# EasyEDA Pro project ProPrj_装配排查_2026-04-26.epro, board PCB2
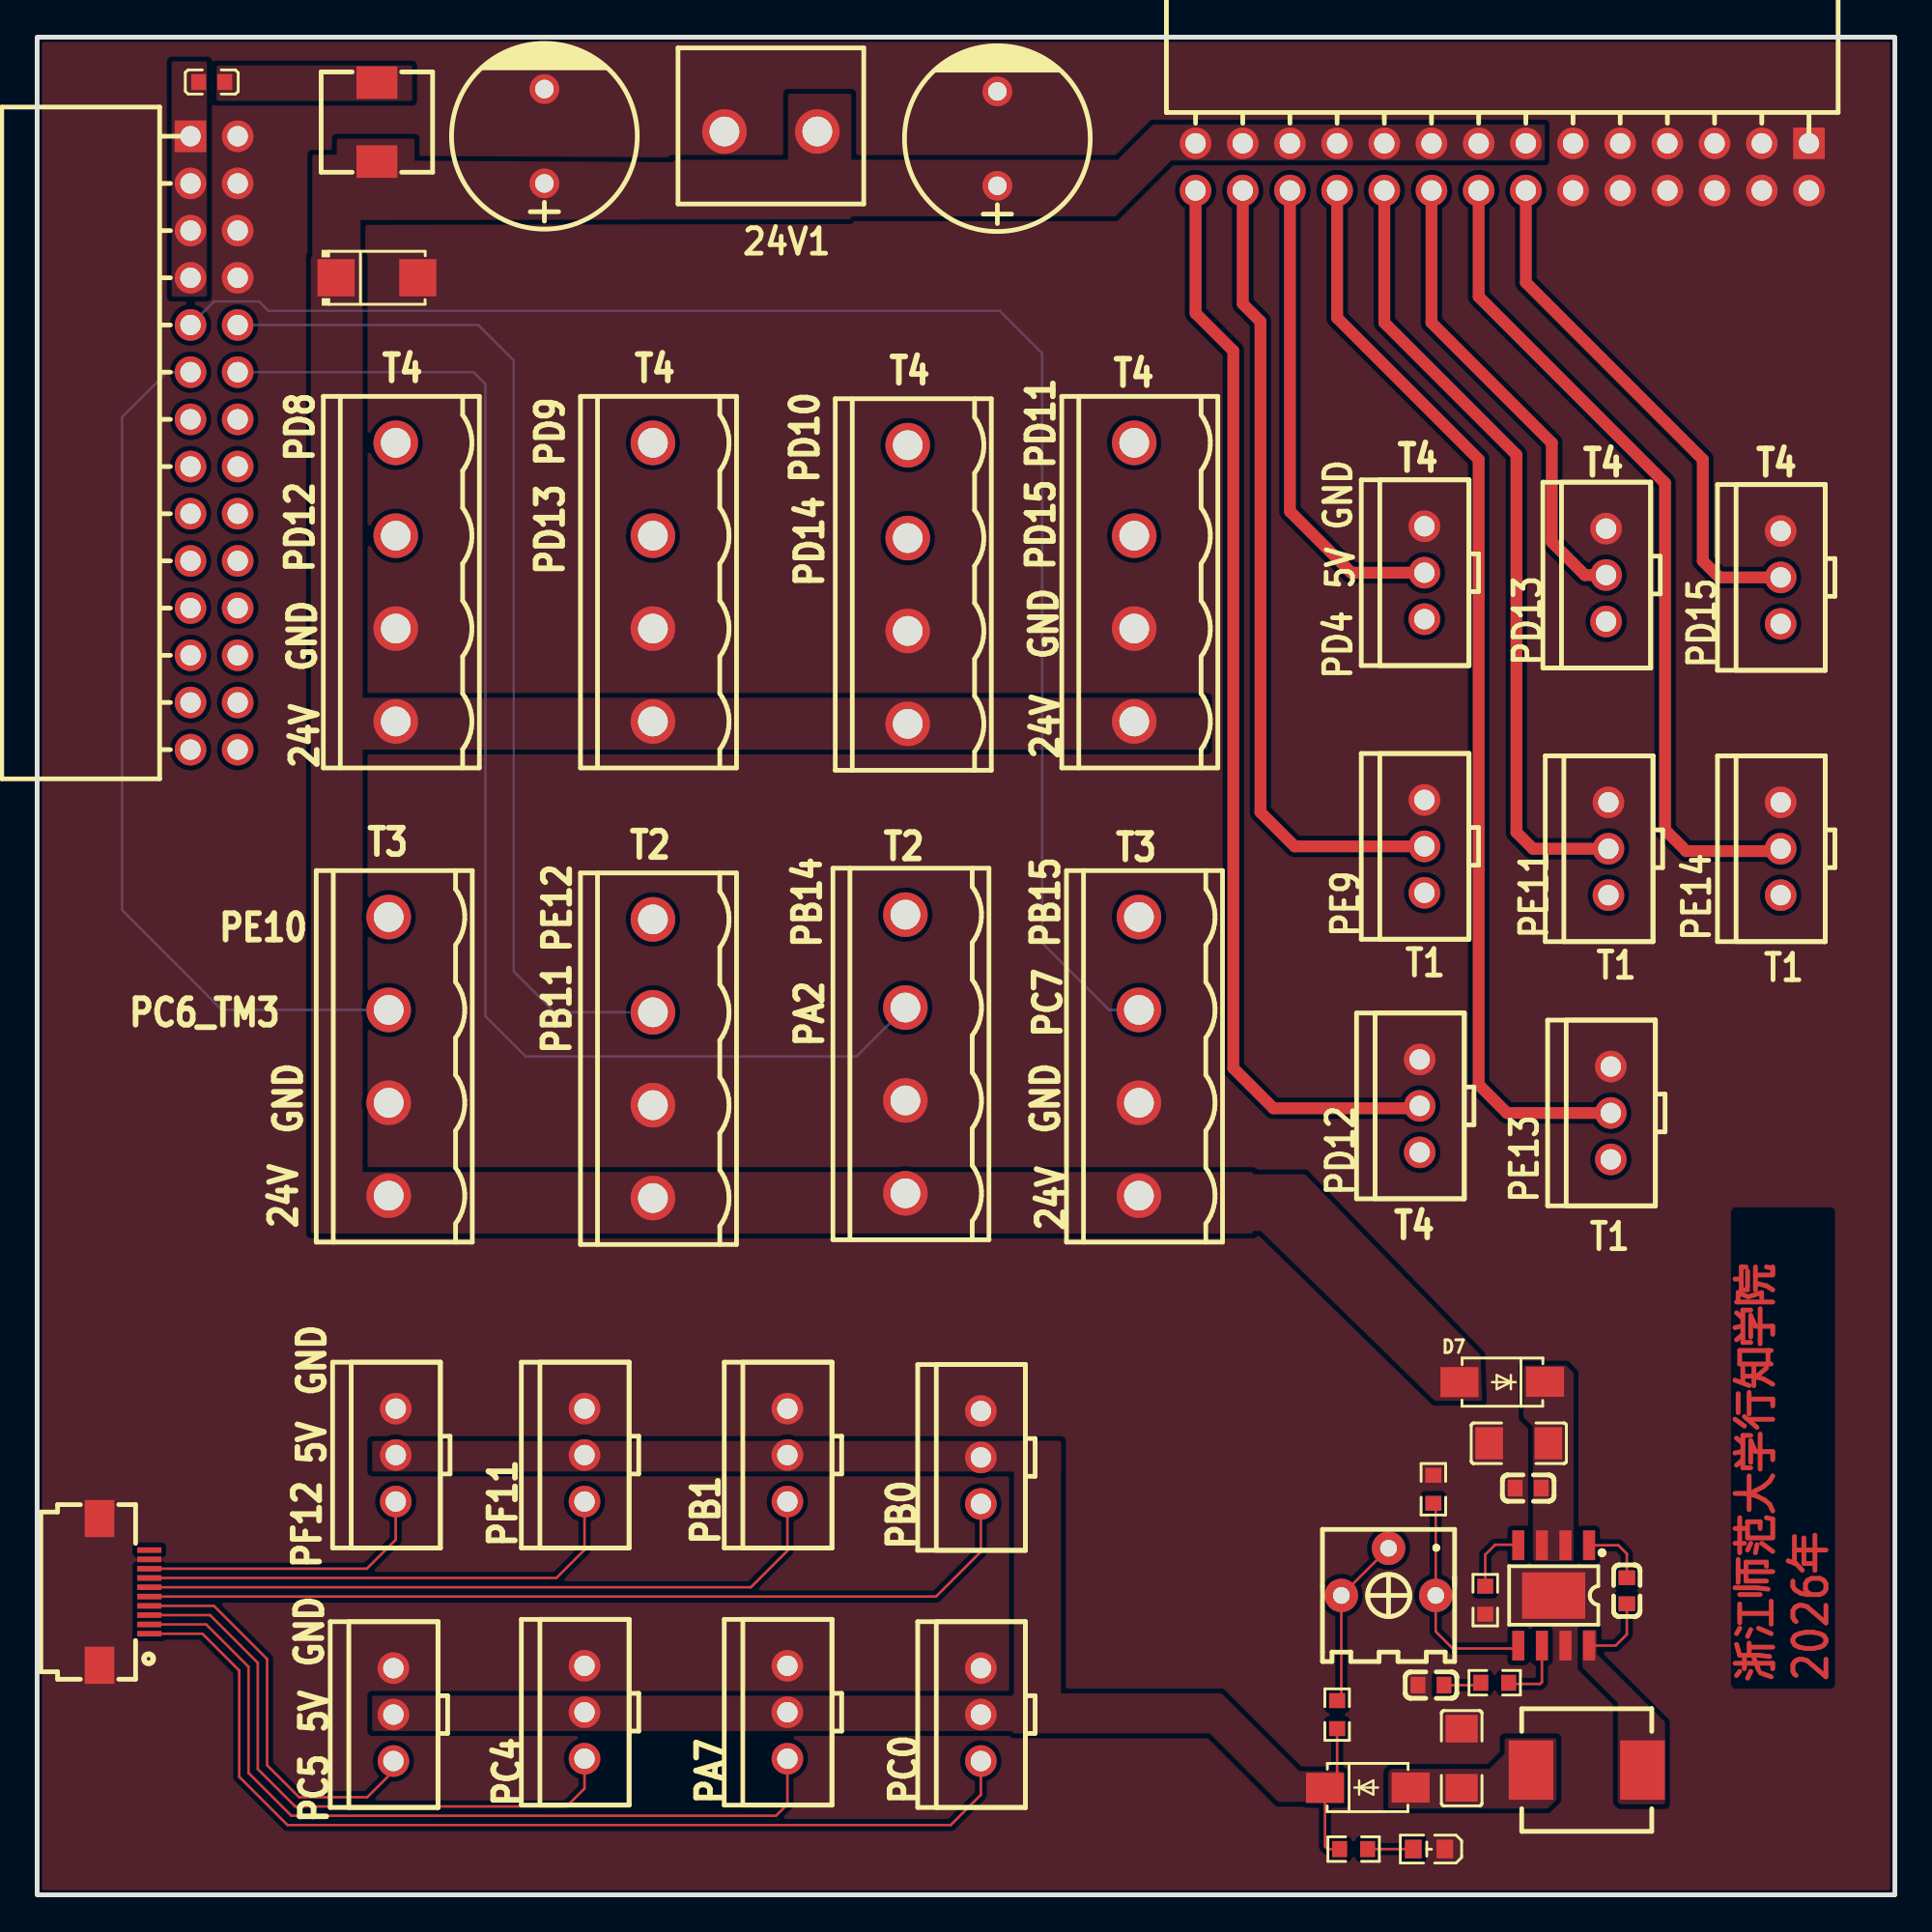
[diagram p2: board, top side]
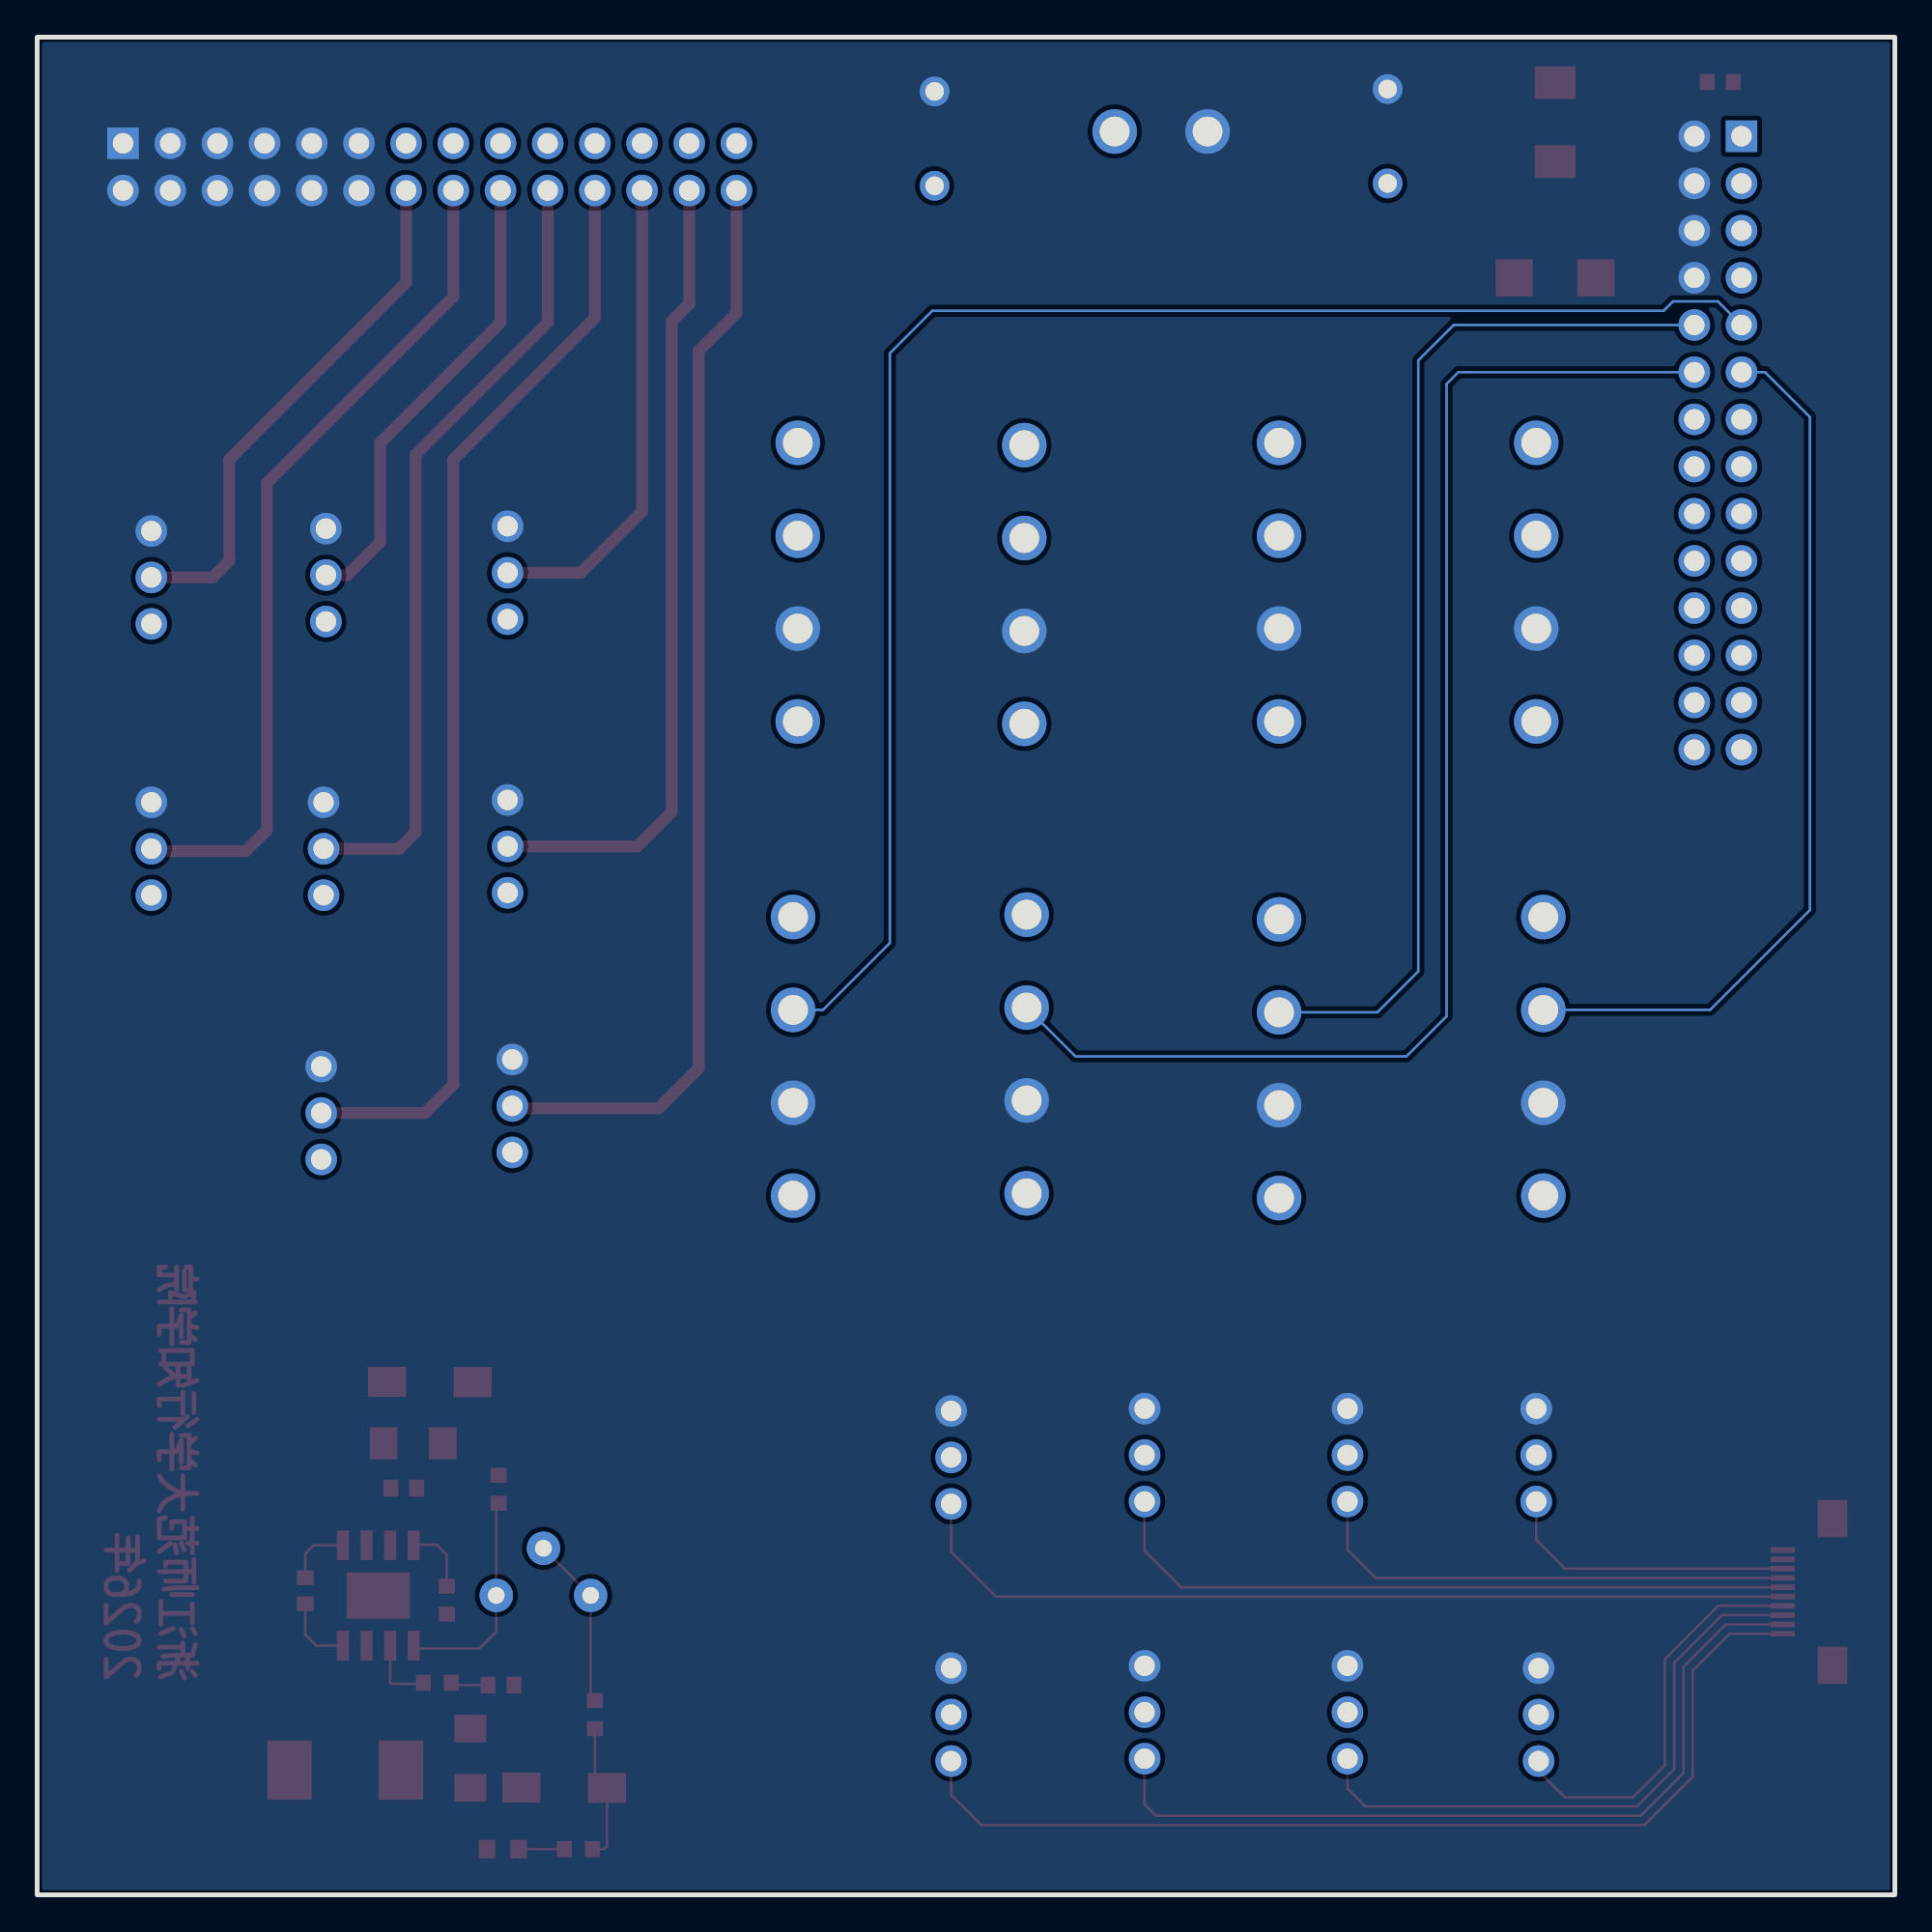
[diagram p3: board, bottom side, seen from below]

Outline 100 x 100 mm; copper layers: Top Layer, Inner1, Inner2, Bottom Layer. Coordinates in mm from the lower left corner of the outline.
Outline path: rectangle 0,100 100,0
Stack: Top Layer 0.035mm / Dielectric1 1.51mm FR4 er 4.5 / Bottom Layer 0.035mm

## Design rules (mm)
spacing copperThickness1oz (default): track to track 0.102, other pairs 0.152 to 0.3
spacing copperThickness2oz: track to track 0.203, other pairs 0.152 to 0.3
track width copperThickness1oz (default): min 0.127, default 0.135, max 2.54
track width copperThickness2oz: min 0.203, default 0.254, max 2.54
differential pair differentialPair (default): width min 0.127, default 0.254, max 2.54; gap min 0.152, default 0.152

## Placement (name value [footprint] x y rotation side)
24V1  12V_IN  [CONN-TH_XY2500V-A-5.00-2P]  39.5 94.92 180 top
C6  470uF  [CAP-TH_BD10.0-P5.00-D1.0-FD]  51.69 94.54 90 top
C7  470uF  [CAP-TH_BD10.0-P5.00-D1.0-FD]  27.3 94.67 90 top
C23  100nF  [C0603]  85.57 16.37 90 top
C24  47uF  [C1206]  76.68 7.35 270 top
C27  4.7uF  [C1206]  79.76 24.31 0 top
C28  100nF  [C0603]  80.26 21.89 0 top
C29  4.7nF  [C0603]  75.03 11.29 0 top
D1  SS54  [SMA_L4.3-W2.6-LS5.2-RD]  18.29 87.05 0 top
D7  SS54  [SMA_L4.3-W2.6-LS5.0-FD]  78.87 27.61 0 top
D8  SS54  [SMA_L4.3-W2.6-LS5.0-FD]  71.63 5.77 180 top
DIANJI1  平滑轨  [CONN-TH_XY2500V-A-5.00-4P]  18.92 45.14 90 top
DIANJI2  平滑轨  [CONN-TH_XY2500V-A-5.00-4P]  33.15 45.01 90 top
DIANJI3  平滑轨  [CONN-TH_XY2500V-A-5.00-4P]  46.74 45.26 90 top
DIANJI4  平滑轨  [CONN-TH_XY2500V-A-5.00-4P]  19.3 70.66 90 top
DIANJI5  平滑轨  [CONN-TH_XY2500V-A-5.00-4P]  59.31 45.14 90 top
DIANJI6  平滑轨  [CONN-TH_XY2500V-A-5.00-4P]  33.15 70.66 90 top
DIANJI7  平滑轨  [CONN-TH_XY2500V-A-5.00-4P]  59.06 70.66 90 top
DIANJI8  平滑轨  [CONN-TH_XY2500V-A-5.00-4P]  46.86 70.54 90 top
FPC1  AFC01-S10FCA-00  [FPC-SMD_P0.5-10P_FGS-XJ-H2.0]  4.7 16.31 90 top
L1  22uH  [IND-SMD_L6.0-W5.2_SUMIDA_CDH53]  18.29 95.43 0 top
L2  BLM18EG121SN1D  [L0603]  9.4 97.59 0 top
L4  4.7uH  [IND-SMD_L7.0-W6.6]  83.41 6.72 180 top
LED5  NCD0603G1  [LED0603-RD_1]  74.93 2.46 180 top
PWM1  HC-XHB-3A  [CONN-TH_3P-P2.50_HC-XHB-3A]  74.42 42.47 90 top
PWM2  HC-XHB-3A  [CONN-TH_3P-P2.50_HC-XHB-3A]  74.68 56.44 90 top
PWM3  HC-XHB-3A  [CONN-TH_3P-P2.50_HC-XHB-3A]  74.68 71.17 90 top
PWM4  HC-XHB-3A  [CONN-TH_3P-P2.50_HC-XHB-3A]  50.8 23.55 90 top
PWM5  HC-XHB-3A  [CONN-TH_3P-P2.50_HC-XHB-3A]  40.39 23.67 90 top
PWM6  HC-XHB-3A  [CONN-TH_3P-P2.50_HC-XHB-3A]  84.71 42.09 90 top
PWM7  HC-XHB-3A  [CONN-TH_3P-P2.50_HC-XHB-3A]  84.58 56.31 90 top
PWM8  HC-XHB-3A  [CONN-TH_3P-P2.50_HC-XHB-3A]  84.45 71.04 90 top
PWM9  HC-XHB-3A  [CONN-TH_3P-P2.50_HC-XHB-3A]  93.85 56.31 90 top
PWM10  HC-XHB-3A  [CONN-TH_3P-P2.50_HC-XHB-3A]  93.85 70.92 90 top
PWM11  HC-XHB-3A  [CONN-TH_3P-P2.50_HC-XHB-3A]  29.46 23.67 90 top
PWM12  HC-XHB-3A  [CONN-TH_3P-P2.50_HC-XHB-3A]  19.3 23.67 90 top
PWM14  HC-XHB-3A  [CONN-TH_3P-P2.50_HC-XHB-3A]  50.8 9.7 90 top
PWM15  HC-XHB-3A  [CONN-TH_3P-P2.50_HC-XHB-3A]  40.39 9.83 90 top
PWM16  HC-XHB-3A  [CONN-TH_3P-P2.50_HC-XHB-3A]  29.46 9.83 90 top
PWM17  HC-XHB-3A  [CONN-TH_3P-P2.50_HC-XHB-3A]  19.18 9.7 90 top
R20  30kΩ  [R0603]  69.98 9.7 270 top
R21  10kΩ  [R0603]  70.87 2.46 180 top
R22  20kΩ  [R0603]  78.46 11.42 180 top
R23  200kΩ  [R0603]  77.95 15.86 90 top
R24  50kΩ  [RES-ADJ-TH_3P-L7.1-W6.9-P2.50-L_3362P]  72.75 17.39 0 top
R25  7.5kΩ  [R0603]  75.16 21.83 270 top
U5  STC2450  [SOP-8E]  81.64 16.12 270 top
U12  Vin  [HDR-TH_28P-P2.54-H-F-R2-C14-W8.5]  78.87 93.01 180 top
U13  OUTPUT  [HDR-TH_28P-P2.54-H-F-R2-C14-W8.5]  9.52 78.16 270 top

## Footprints (pads in the part's own frame, mm; a bottom-side part is the same pattern mirrored in y, then rotated)
C0603
  rect 0.8x0.9 smd: 1(-0.7,0) 2(0.7,0)
C1206
  rect 1.485x1.728 smd: 1(-1.593,0) 2(1.593,0)
CAP-TH_BD10.0-P5.00-D1.0-FD
  round 1.6 hole 1: 1(-2.54,0) 2(2.54,0)
CONN-TH_3P-P2.50_HC-XHB-3A
  round 1.7 hole 1.1: 1(-2.5,0) 2(0,0) 3(2.5,0)
CONN-TH_XY2500V-A-5.00-2P
  round 2.4 hole 1.6: 1(-2.5,0) 2(2.5,0)
CONN-TH_XY2500V-A-5.00-4P
  round 2.4 hole 1.6: 1(-7.5,0) 2(-2.5,0) 3(2.5,0) 4(7.5,0)
FPC-SMD_P0.5-10P_FGS-XJ-H2.0
  rect 0.3x1.3 smd: 1(-2.25,-1.339) 2(-1.75,-1.339) 3(-1.25,-1.34) 4(-0.75,-1.339) 5(-0.25,-1.34) 6(0.25,-1.339) 7(0.75,-1.339) 8(1.25,-1.339) 9(1.75,-1.339) 10(2.25,-1.34)
  rect 2x1.6 smd: 11(3.95,1.34) 12(-3.95,1.34)
HDR-TH_28P-P2.54-H-F-R2-C14-W8.5
  rect 1.7x1.7 hole 1.1: 1(-16.51,-1.27)
  round 1.7 hole 1.1: 2(-16.51,1.27) 3(-13.97,-1.27) 4(-13.97,1.27) 5(-11.43,-1.27) 6(-11.43,1.27) 7(-8.89,-1.27) 8(-8.89,1.27) 9(-6.35,-1.27) 10(-6.35,1.27) 11(-3.81,-1.27) 12(-3.81,1.27) 13(-1.27,-1.27) 14(-1.27,1.27) 15(1.27,-1.27) 16(1.27,1.27) 17(3.81,-1.27) 18(3.81,1.27) 19(6.35,-1.27) 20(6.35,1.27) 21(8.89,-1.27) 22(8.89,1.27) 23(11.43,-1.27) 24(11.43,1.27) 25(13.97,-1.27) 26(13.97,1.27) 27(16.51,-1.27) 28(16.51,1.27)
IND-SMD_L6.0-W5.2_SUMIDA_CDH53
  rect 2.2x1.75 smd: 1(0,2.125) 2(0,-2.125)
IND-SMD_L7.0-W6.6
  rect 2.4x3.2 smd: 1(-3,0) 2(3,0)
L0603
  rect 0.8x0.864 smd: 1(-0.7,0) 2(0.7,0)
LED0603-RD_1
  rect 0.9x1 smd: 1(-0.85,0) 2(0.85,0)
R0603
  rect 0.806x0.864 smd: 1(-0.753,0) 2(0.753,0)
RES-ADJ-TH_3P-L7.1-W6.9-P2.50-L_3362P
  round 1.8 hole 0.9: 1(-2.54,-1.27) 2(0,1.27) 3(2.54,-1.27)
SMA_L4.3-W2.6-LS5.0-FD
  rect 2.046x1.62 smd: 1(-2.304,-0.009) 2(2.304,0.009)
SMA_L4.3-W2.6-LS5.2-RD
  rect 2x2 smd: 1(-2.2,0) 2(2.2,0)
SOP-8E
  rect 2.5x3.4 smd: 0(0,0)
  rect 1.6x0.65 smd: 1(-2.7,1.905) 2(-2.7,0.635) 3(-2.7,-0.635) 4(-2.7,-1.905) 5(2.7,-1.905) 6(2.7,-0.635) 7(2.7,0.635) 8(2.7,1.905)

## Nets
As in the schematic.

## Routing (per net, layer and track width the routed paths; a pad name or vN(x,y) marks a point on that pad's centre or on a via; arc(x,y) is an arc through that point)
5V_1: length 59.1
  Top Layer w0.635: PWM1.2 74.29,42.34 66.55,42.34 64.39,44.5 64.39,83.11 62.36,85.14 U12.28
5V_2: length 43.4
  Top Layer w0.635: PWM2.2 67.69,56.44 65.85,58.28 65.85,84.7 64.9,85.65 U12.26
5V_3: length 25.9
  Top Layer w0.635: PWM3.2 70.74,71.17 67.44,74.47 U12.24
5V_4: length 59
  Top Layer w0.635: PWM6.2 79.12,42.09 77.6,43.61 77.6,77.27 69.98,84.89 U12.22
5V_5: length 42.8
  Top Layer w0.635: PWM7.2 80.52,56.31 79.63,57.2 79.63,77.52 72.52,84.63 U12.20
5V_6: length 25.3
  Top Layer w0.635: PWM8.2 83.31,71.04 81.53,72.82 81.53,78.16 75.06,84.63 U12.18
5V_7: length 45.4
  Top Layer w0.635: 93.85,55.8 93.47,56.18 88.77,56.18 87.63,57.33 87.63,76 77.6,86.03 U12.16
5V_8: length 28.4
  Top Layer w0.635: U12.14 80.14,86.79 89.66,77.27 89.66,71.81 90.55,70.92 PWM10.2
5V_HD: length 7.5
  Top Layer w0.135: D8.2 69.32,2.61 69.47,2.46 R21.2 ; R20.2 69.98,6.24 69.41,5.67
PA2_TIM2_CH3: length 72.2
  Bottom Layer w0.135: U13.12 23.49,81.97 24.13,81.33 24.13,47.29 26.29,45.14 44.11,45.14 DIANJI3.3
PA7_ADC1_INP7: length 44.7
  Top Layer w0.135: PWM15.1 40.39,4.87 39.77,4.26 13.68,4.26 11.38,6.56 11.38,12.28 9.1,14.56 FPC1.2
PB0_ADC1_INP9: length 48.3
  Top Layer w0.135: PWM4.1 50.8,18.47 48.39,16.06 FPC1.5
PB1_ADC1_INP5: length 37.8
  Top Layer w0.135: FPC1.6 38.42,16.56 40.39,18.52 PWM5.1
PB11_TIM2_CH4: length 56.9
  Bottom Layer w0.135: DIANJI2.3 27.85,47.51 25.65,49.71 25.65,82.6 23.75,84.51 10.8,84.51
PB14_DIR_CONV: length 43.4
  Inner1 w0.135: U13.24 12.45,65.07 12.45,63.68 18.29,57.84 43.17,57.84 46.74,54.27 DIANJI3.4
PB15_DIR_CONV: length 58.4
  Inner1 w0.135: DIANJI5.4 59.31,54.97 55.66,58.62 18.65,58.62 13.21,64.06 13.21,66.85 U13.22
PC0_ADC1_INP10: length 54.9
  Top Layer w0.135: PWM14.1 50.8,5.38 49.17,3.76 13.48,3.76 10.88,6.36 10.88,12.07 8.89,14.06 FPC1.1
PC4_ADC1_INP4: length 33
  Top Layer w0.135: FPC1.3 9.31,15.06 11.88,12.49 11.88,6.77 13.89,4.76 28.5,4.76 29.46,5.72 PWM16.1
PC5_ADC1_INP8: length 21.9
  Top Layer w0.135: PWM17.1 19.18,6.66 17.77,5.26 14.1,5.26 12.38,6.98 12.38,12.69 9.51,15.56 FPC1.4
PC6_TIM3_CH1: length 47.8
  Bottom Layer w0.135: DIANJI1.3 9.95,47.64 4.57,53.01 4.57,79.55 6.98,81.97 U13.11
PC7_TIM3_CH2: length 86
  Bottom Layer w0.135: DIANJI5.3 57.7,47.64 54.1,51.23 54.1,82.98 51.82,85.27 12.45,85.27 11.94,85.78 9.52,85.78 8.25,84.51
PD8_DIR_CONV: length 11.1
  Inner1 w0.135: DIANJI4.4 19.3,78.16 12.95,71.81 U13.20
PD9_DIR_CONV: length 26.3
  Inner1 w0.135: DIANJI6.4 33.15,78.57 31.02,80.7 18.29,80.7 11.94,74.35 U13.18
PD10_DIR_CONV: length 40.4
  Inner1 w0.135: DIANJI8.4 46.86,79.72 45.13,81.46 16.76,81.46 12.19,76.89 U13.16
PD11_DIR_CONV: length 52.3
  Inner1 w0.135: U13.14 13.46,79.43 16.26,82.22 57.03,82.22 59.06,80.2 DIANJI7.4
PD12_TIM4_CH1_CONV: length 93.1
  Inner2 w0.135: U13.19 9.52,73.08 19.22,73.08 DIANJI4.3 19.47,73.33 23.62,73.33 25.27,71.68 25.27,62.15 29.21,58.22 64.01,58.22 67.56,54.66 67.56,42.85 70.44,39.97 PWM1.1
PD13_TIM4_CH2_CONV: length 87.8
  Inner2 w0.135: U13.17 9.52,75.62 30.23,75.62 32.68,73.16 DIANJI6.3 33.15,72.69 46.07,59.77 65.31,59.77 68.33,62.79 79.76,62.79 84.45,67.49 PWM8.1
PD14_TIM4_CH3_CONV: length 76.4
  Inner2 w0.135: U13.15 9.52,78.16 13.46,78.16 16.13,80.82 39.76,80.82 40.84,79.75 40.84,74.15 41.91,73.08 46.82,73.08 DIANJI8.3 49.36,70.54 63.25,70.54 65.11,68.67 PWM3.1
PD15_TIM4_CH4_CONV: length 99.4
  Inner2 w0.135: PWM10.1 91.65,68.42 89.92,70.16 89.92,75.62 87.38,78.16 64.05,78.16 DIANJI7.3 50.51,81.71 14.6,81.71 13.59,80.7 9.52,80.7 U13.13
PE9_TIM1_CH1_CONV: length 115
  Inner1 w0.135: 8.25,61.65 8.25,36.51 11.44,33.32 68.83,33.32 71.37,35.86 74.8,35.86 78.23,39.29 78.23,50.38 PWM2.1
PE10_DIR_CONV: length 13
  Inner1 w0.135: 10.8,61.65 11.81,61.65 18.92,54.53 DIANJI1.4
PE11_TIM1_CH2_CONV: length 125.4
  Inner1 w0.135: PWM7.1 81.45,53.81 79.25,51.61 79.25,38.66 75.31,34.72 71.88,34.72 69.54,32.38 9.88,32.38 6.48,35.78 6.48,62.92 7.75,64.19 U13.25
PE12_DIR_CONV: length 27.9
  Inner1 w0.135: DIANJI2.4 33.15,53.8 29.88,57.07 17.91,57.07 U13.26
PE13_TIM1_CH3_CONV: length 118.9
  Inner1 w0.135: U13.23 8,66.73 5.46,64.19 5.46,35.36 9.45,31.36 69.67,31.36 72.27,33.97 81.3,33.97 85.49,38.16 85.49,38.81 PWM6.1
PE14_TIM1_CH4_CONV: length 141.6
  Inner1 w0.135: 93.85,53.3 92.33,51.78 92.33,43.36 82.05,33.08 72.64,33.08 70.03,30.47 9.09,30.47 4.57,34.99 4.57,65.96 7.87,69.27 U13.21
PF11_ADC1_INP2: length 26.7
  Top Layer w0.135: PWM11.1 29.46,18.57 27.95,17.06 FPC1.7
PF12_ADC1_INP6: length 16
  Top Layer w0.135: PWM12.1 19.3,19.11 17.75,17.56 FPC1.8
$1N152: length 2.5
  Top Layer w0.135: R21.1 LED5.2
$1N155: length 2
  Top Layer w0.135: R22.2 77.58,11.29 C29.2
$1N156: length 3.8
  Top Layer w0.135: R22.1 79.28,11.35 80.9,11.35 81,11.46 U5.6
$1N157: length 11.8
  Top Layer w0.135: R25.2 75.29,20.95 R24.3 75.29,14.17 76.2,13.26 79.57,13.26 U5.5
$1N158: length 9.3
  Top Layer w0.135: R24.2 R24.1 70.21,10.69 R20.1
$1N162: length 3.9
  Top Layer w0.135: C23.1 85.57,14.02 84.97,13.42 U5.8
$1N163: length 3.5
  Top Layer w0.135: C23.2 85.57,18.36 85.12,18.82 U5.1
$1N170: length 3.7
  Top Layer w0.135: R23.2 77.95,18.31 78.49,18.85 79.7,18.85 U5.4

## Copper pours and planes (outline as drawn; the poured copper is in the pictures)
5V_HD on Top Layer: 52.58,24.44 55.12,24.44 55.12,8.81 52.58,8.81
5V_HD on Top Layer: 18.03,24.44 55.12,24.44 55.12,22.78 18.03,22.78
5V_HD on Top Layer: 18.03,10.72 55.12,10.72 55.12,8.81 18.03,8.81
5V_HD on Top Layer: 70.36,5.13 70.23,5 66.8,5 63.12,8.69 52.58,8.69 52.45,8.81 52.45,10.72 52.58,10.85 63.75,10.85 67.94,6.66 70.23,6.66 70.36,6.53
24V on Top Layer: 14.81,93.67 16.3,93.67 17.41,93.7 17.41,85.34 14.81,85.34
24V on Top Layer: 14.85,90.15 14.85,93.38 40.42,93.23 40.42,96.95 43.82,96.95 43.82,90.29 43.73,90.2
24V on Top Layer: 14.73,88.21 17.53,88.21 17.53,35.61 14.73,35.61
24V on Top Layer: 62.99,61.65 14.86,61.65 14.86,64.44 62.99,64.44
24V on Top Layer: 14.86,38.91 65.45,38.91 65.45,35.6 14.86,35.6
24V on Top Layer: 16.13,94.54 20.32,94.54 20.32,90.98 16.13,90.98
24V on Top Layer: 59.94,38.79 68.25,38.79 77.7,29.06 77.78,26.59 75.23,26.59 65.87,35.74 59.94,35.74
24V on Top Layer: 34.16,93.4 58.17,93.4 60.07,95.3 81.15,95.3 81.15,93.36 61.05,93.36 58.04,90.35 34.25,90.35 34.25,93.31
GND on Top Layer: 0,100 107.82,100 107.82,-1.09 0,-1.09
GND on Bottom Layer: -14.99,112.06 110.36,112.06 110.36,-9.09 -14.99,-9.09
GND on Inner1: -10.03,104.06 101.35,104.06 101.35,-0.46 -10.03,-0.46
GND on Inner2: -3.94,104.7 124.08,104.7 124.08,-11.76 -3.94,-11.76
$1N161 on Top Layer: 81.79,8.43 81.79,5.13 81.3,4.65 72.73,4.65 72.73,6.61 72.9,6.78 78.18,6.78 78.99,7.6 78.99,8.43
$1N162 on Top Layer: 83.19,14.28 83.96,14.28 83.96,12.96 87.63,9.29 87.63,4.88 85.22,4.88 85.09,5 85.09,10.34 83.19,12.24
$1N167 on Top Layer: 80.01,28.5 82.3,28.5 82.71,28.09 82.71,17.96 80.65,17.96 80.52,18.09 80.52,25.2 80.01,25.7
$1N222 on Top Layer: 9.65,98.48 20.19,98.48 20.19,96.57 9.65,96.57
$1N224 on Top Layer: 7.24,98.69 9.14,98.69 9.14,86.03 7.24,86.03

## Text on the board
Top Layer: 浙江师范大学行知学院 / 2026年
Top Silkscreen Layer: T1 | GND | PD4 | 5V | PD12 | PE9 | PE13 | PD13 | PE11 | PE14 | PD15 | PC6_TM3 | PE10 | T3 | T4 | T2 | 24V | PD8 | PF12 | PC5 | PF11 | PC4 | PD9 | PB11 | PE12 | PB1 | PA7 | PD10 | PB14 | PD14 | PA2 | PB0 | PC0 | PD11 | PB15 | PC7
